# Altium schematic sheet can&usb.SchDoc
size 317 x 304 mm; SheetNumber: 4; SheetTotal: 5
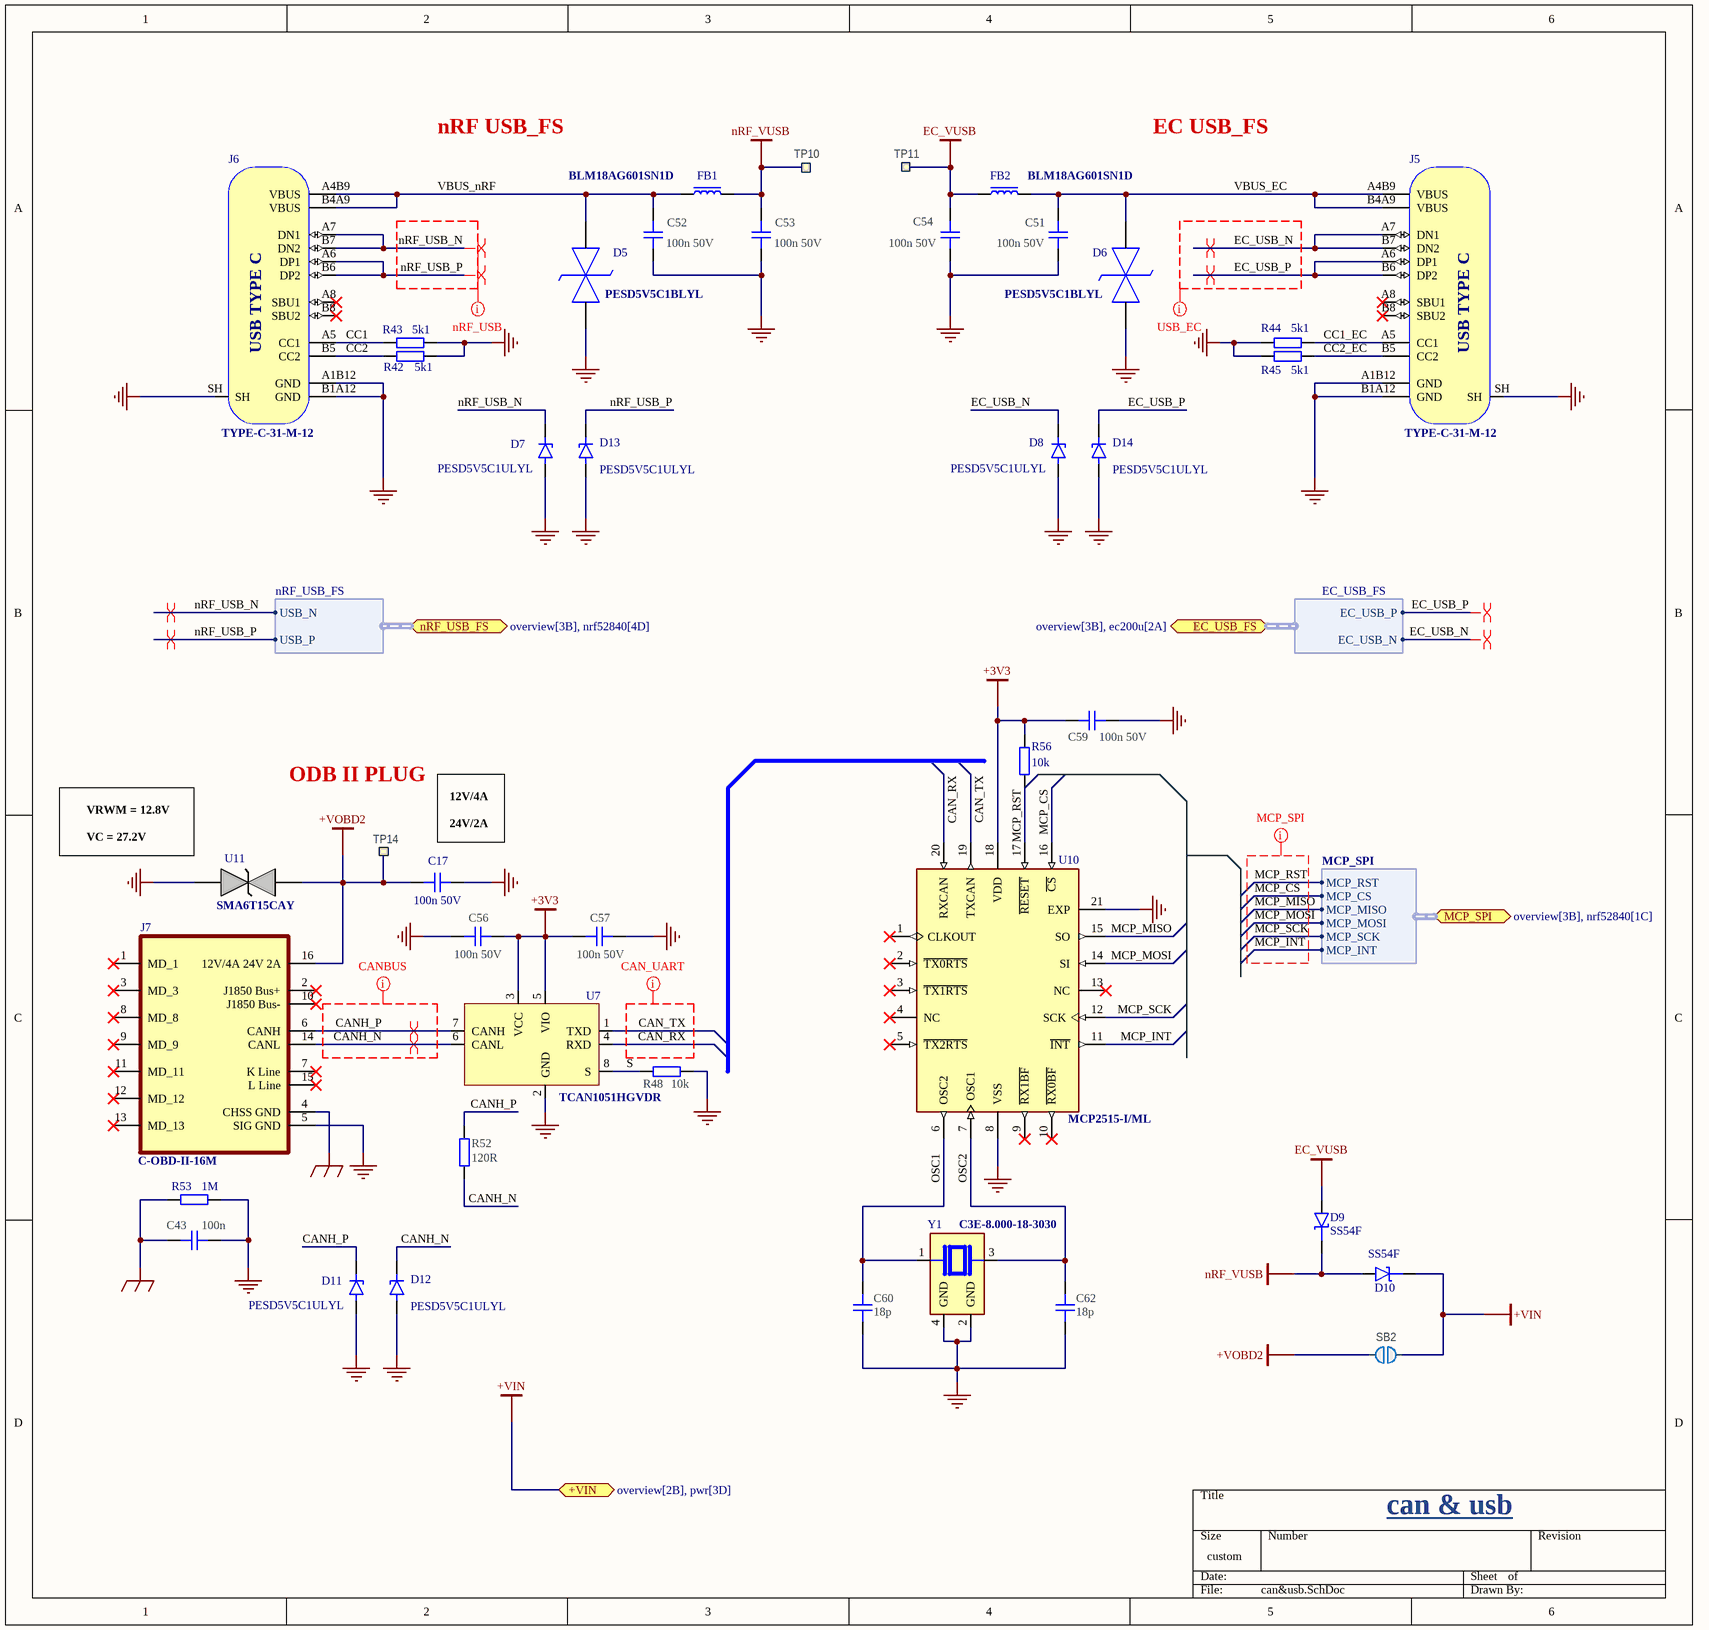
[diagram p0: can&usb.SchDoc]

## Parts
C17  100n 50V  [CAP_0805]
C43  100n  [CAPC2012X11L]
C51  100n 50V  [CAPC1005X04L]
C52  100n 50V  [CAPC1005X04L]
C53  100n 50V  [CAPC1005X04L]
C54  100n 50V  [CAPC1005X04L]
C56  100n 50V  [CAPC1005X04L]
C57  100n 50V  [CAPC1005X04L]
C59  100n 50V  [CAPC1005X04L]
C60  18p  [CAPC1005X04L]
C62  18p  [CAPC1005X04L]
D5  PESD5V5C1BLYL  [PESD5V5C1BLYL]
D6  PESD5V5C1BLYL  [PESD5V5C1BLYL]
D7  PESD5V5C1ULYL  [DIO_PESD5V5C1ULYL]
D8  PESD5V5C1ULYL  [DIO_PESD5V5C1ULYL]
D9  SS54F  [DIOM5226X100N]
D10  SS54F  [DIOM5226X100N]
D11  PESD5V5C1ULYL  [DIO_PESD5V5C1ULYL]
D12  PESD5V5C1ULYL  [DIO_PESD5V5C1ULYL]
D13  PESD5V5C1ULYL  [DIO_PESD5V5C1ULYL]
D14  PESD5V5C1ULYL  [DIO_PESD5V5C1ULYL]
FB1  BLM18AG601SN1D  [FB_0603]
FB2  BLM18AG601SN1D  [FB_0603]
J5  TYPE-C-31-M-12  [TYPE-C-31-M-12]
J6  TYPE-C-31-M-12  [TYPE-C-31-M-12]
J7  C-OBD-II-16M  [COMTECH_C-OBD-II-16M]
R42  5k1  [RES_0603]
R43  5k1  [RES_0603]
R44  5k1  [RES_0603]
R45  5k1  [RES_0603]
R48  10k  [RESC1005X04L]
R52  120R  [RESC1005X04L]
R53  1M  [RES_0603]
R56  10k  [RES_0603]
SB2  Solderbridge  [Solderbridge]  (value not drawn)  (no BOM)
TP10  Ø1.0mm,SMD  [TP_SMD_D1.0mm]  (value not drawn)  (no BOM)
TP11  Ø1.0mm,SMD  [TP_SMD_D1.0mm]  (value not drawn)  (no BOM)
TP14  Ø1.5mm,SMD  [TP_SMD_D1.5mm]  (value not drawn)  (no BOM)
U7  TCAN1051HGVDR  [SOIC-8]
U10  MCP2515-I/ML  [QFN50P400X400X100-21N]
U11  SMA6T15CAY  [SMA_BI_STM]
Y1  C3E-8.000-18-3030  [XTAL_C3E-8.000-18-3030-X-R]

## Ports
+VIN (bidir, see overview[2B], pwr[3D]), EC_USB_FS (bidir, harness EC_USB_FS, see overview[3B], ec200u[2A]), MCP_SPI (bidir, harness MCP_SPI, see overview[3B], nrf52840[1C]), nRF_USB_FS (bidir, harness nRF_USB_FS, see overview[3B], nrf52840[4D])

## Harnesses
nRF_USB_FS: USB_N, USB_P
EC_USB_FS: EC_USB_N, EC_USB_P
MCP_SPI: MCP_RST, MCP_CS, MCP_MISO, MCP_MOSI, MCP_SCK, MCP_INT

## Nets
+3V3: C56.1 C57.2 C59.2 R56.1 U7.3(VCC) U7.5(VIO) U10.18(VDD)
+VIN: D10.K SB2.1 ; port +VIN
+VOBD2: C17.2 J7.16(12V/4A_24V_2A) SB2.2 TP14.1 U11.2
C_GND: C43.1 J7.4(CHSS_GND) R53.1
EC_VUSB: C54.1 D9.A FB2.1 TP11.1
GND: C17.1 C43.2 C51.2 C52.2 C53.2 C54.2 C56.2 C57.1 C59.1 C60.1 C62.1 D5.2(K2) D6.2(K2) D7.A D8.A D11.A D12.A D13.A D14.A J5.A1B12(GND) J5.B1A12(GND) J5.SH J6.A1B12(GND) J6.B1A12(GND) J6.SH J7.5(SIG_GND) R42.1 R43.1 R44.1 R45.1 R48.2 R53.2 U7.2(GND) U10.8(VSS) U10.21(EXP) U11.1 Y1.2(GND) Y1.4(GND)
nRF_VUSB: C53.1 D9.K D10.A FB1.1 TP10.1
CAN_RX: U7.4(RXD) U10.20(RXCAN)
CAN_TX: U7.1(TXD) U10.19(TXCAN)
CANH_N: D12.K J7.14(CANL) R52.2 U7.6(CANL)
CANH_P: D11.K J7.6(CANH) R52.1 U7.7(CANH)
CC1: J6.A5(CC1) R43.2
CC1_EC: J5.A5(CC1) R44.2
CC2: J6.B5(CC2) R42.2
CC2_EC: J5.B5(CC2) R45.2
EC_USB_N: D8.K J5.A7(DN1) J5.B7(DN2) ; port EC_USB_FS.EC_USB_N
EC_USB_P: D14.K J5.A6(DP1) J5.B6(DP2) ; port EC_USB_FS.EC_USB_P
MCP_CS: U10.16(~{CS}) ; port MCP_SPI.MCP_CS
MCP_INT: U10.11(~{INT}) ; port MCP_SPI.MCP_INT
MCP_MISO: U10.15(SO) ; port MCP_SPI.MCP_MISO
MCP_MOSI: U10.14(SI) ; port MCP_SPI.MCP_MOSI
MCP_RST: R56.2 U10.17(~{RESET}) ; port MCP_SPI.MCP_RST
MCP_SCK: U10.12(SCK) ; port MCP_SPI.MCP_SCK
nRF_USB_N: D7.K J6.A7(DN1) J6.B7(DN2) ; port nRF_USB_FS.USB_N
nRF_USB_P: D13.K J6.A6(DP1) J6.B6(DP2) ; port nRF_USB_FS.USB_P
OSC1: C60.2 U10.6(OSC2) Y1.1
OSC2: C62.2 U10.7(OSC1) Y1.3
S: R48.1 U7.8(S)
VBUS_EC: C51.1 D6.1(K1) FB2.2 J5.A4B9(VBUS) J5.B4A9(VBUS)
VBUS_nRF: C52.1 D5.1(K1) FB1.2 J6.A4B9(VBUS) J6.B4A9(VBUS)

Not connected (* = marked no-connect by the designer): J5 A8(SBU1)* B8(SBU2)*; J6 A8(SBU1)* B8(SBU2)*; J7 1(MD_1)* 2(J1850_Bus+)* 3(MD_3)* 7(K_Line)* 8(MD_8)* 9(MD_9)* 10(J1850_Bus-)* 11(MD_11)* 12(MD_12)* 13(MD_13)* 15(L_Line)*; U10 1(CLKOUT)* 2(~{TX0RTS})* 3(~{TX1RTS})* 4(NC)* 5(~{TX2RTS})* 9(~{RX1BF})* 10(~{RX0BF})* 13(NC)*

## Layout directives
differential pair: CANH_N, CANH_P, EC_USB_N, EC_USB_P, nRF_USB_N, nRF_USB_P
net class CANBUS: CANH_N, CANH_P
net class CAN_UART: CAN_RX, CAN_TX
net class nRF_USB: nRF_USB_N, nRF_USB_P
net class USB_EC: EC_USB_N, EC_USB_P
mark named MCP_SPI: MCP_CS, MCP_INT, MCP_MISO, MCP_MOSI, MCP_RST, MCP_SCK

## Notes on the sheet
- nRF USB_FS
- EC USB_FS
- ODB II PLUG
- 12V/4A
  24V/2A
- (near U11) VRWM = 12.8V
  VC = 27.2V
- can & usb
- (in symbol TYPE-C-31-M-12) USB TYPE C

## Library data of the parts
C17 = CAP_0805: Capacitor SMD 0805; Manufacturer: *; Manufacturer Part Number: *; Distributor Link: *; LCSC: *; Rating: *; Dielectric: *
C43 = C0805-4µ7: Capacitor, X5R, ±10%, 16V; Manufacturer: N.A.; Part number IPS: 00000006289; Part number NEMS: 100200284; Value: 4.7µF; Artikkelnr Noca: 20039266; Pad Count: 2; Component Status: Active; Part Number: C0805-4µ7; Manufacturer Part Number: N.A.; ComponentLink1URL: N.A.; ComponentLink1Description: Datasheet; ComponentLink2URL: N.A.; ComponentLink2Description: Supplier link; HelpURL: N.A.; Footprint Doc: 0805; LatestRevisionDate: 2020-04-28; Published: 2009-08-21; Note: 16V; Supplier 1: N.A.; Supplier Part Number 1: N.A.; Supplier 2: N.A.; Supplier Part Number 2: N.A.; PartId: 100200284; Component Class: Capacitors; Author: rsk; Part number Norautron: N.A.
C51-C54 C56 C57 C59 C60 C62 = C0402-4µ7: Capacitor, X5R, ±20%; Manufacturer: N.A.; Part number IPS: 00000001251, 00000007165; Part number NEMS: 100200193; Value: 4.7µF; Note: 10V; Artikkelnr Noca: 20039482; Pad Count: 2; Component Status: Active; Part Number: C0402-4µ7; Manufacturer Part Number: N.A.; ComponentLink1URL: N.A.; ComponentLink1Description: Datasheet; ComponentLink2URL: N.A.; ComponentLink2Description: Supplier link; HelpURL: N.A.; Footprint Doc: 0402; LatestRevisionDate: 2017-11-09; Published: 2009-05-08; Supplier 1: Digi-Key; Supplier Part Number 1: 490-13252-1-ND; Supplier 2: N.A.; Supplier Part Number 2: N.A.; PartId: 100200193; Component Class: Capacitors; Author: rsk; Part number Norautron: N.A.
D5 D6 = PESD5V5C1BLYL: PESD5V5C1BL - Extremely low clamping bidirectional ESD protection diode@en-us; Manufacturer_Name: Nexperia; Geometry.Height: 0.5mm; Manufacturer_Part_Number: PESD5V5C1BLYL; Mouser Part Number: 771-PESD5V5C1BLYL; Mouser Price/Stock: https://www.mouser.co.uk/ProductDetail/Nexperia/PESD5V5C1BLYL?qs=3Rah4i%252BhyCFwc8nZBq0KPQ%3D%3D; Arrow Part Number: PESD5V5C1BLYL; Arrow Price/Stock: https://www.arrow.com/en/products/pesd5v5c1blyl/nexperia?utm_currency=USD&region=nac; Datasheet Link: https://assets.nexperia.com/documents/data-sheet/PESD5V0S1BA_BB_BL.pdf
D7 D8 D11-D14 = PESD5V5C1ULYL: Esd Protection Device, 5.5V, Dfn1006 Rohs Compliant: Yes |Nexperia PESD5V5C1ULYL; MF: Nexperia USA Inc.; SnapEDA_Link: https://www.snapeda.com/parts/PESD5V5C1ULYL/Nexperia/view-part/?ref=snap; Package: SOD-882 Nexperia USA; Value: *; MP: PESD5V5C1ULYL; Check_prices: https://www.snapeda.com/parts/PESD5V5C1ULYL/Nexperia/view-part/?ref=eda
D9 D10 = Schottky Diode_3: Schottky Diode SMD SMAF package
FB1 FB2 = FB_0603: Ferrite Bead SMD 0603; Manufacturer: *; Manufacturer Part Number: *; Distributor Link: *; LCSC: *
J5 J6 = TYPE-C-31-M-12: USB Type C Connector Horizontal SMT; Manufacturer: Koren Hroparts; Manufacturer Part Number: TYPE-C-31-M-12
J7 = C-OBD-II-16M: OBD II 16pin 90 Degree Angle Male Plug Connector; MF: Comtech Electronic Co., LTD; SnapEDA_Link: https://www.snapeda.com/parts/C-OBD-II-16M/Comtech+Electronic+Co.%252C+LTD/view-part/?ref=snap; Package: None; Value: *; MP: C-OBD-II-16M; Check_prices: https://www.snapeda.com/parts/C-OBD-II-16M/Comtech+Electronic+Co.%252C+LTD/view-part/?ref=eda
R42-R45 R53 R56 = RES_0603: Resistor SMD 0603; Manufacturer: *; Manufacturer Part Number: *; Distributor Link: *; LCSC: *
R48 R52 = R0402-0R: Resistor, ±5%, 0.063W; Manufacturer: N.A.; Part number IPS: 00000007128; Part number NEMS: 100100109; Value: 0R; Note: Chip Res 5%; Artikkelnr Noca: 27049000; Pad Count: 2; Component Status: Active; Part Number: R0402-0R; Manufacturer Part Number: N.A.; ComponentLink1URL: N.A.; ComponentLink1Description: Datasheet; ComponentLink2URL: N.A.; ComponentLink2Description: Supplier link; HelpURL: N.A.; Footprint Doc: 0402; LatestRevisionDate: 2009-11-23; Published: 2009-05-08; Supplier 1: Farnell; Supplier Part Number 1: 146-9661; Supplier 2: N.A.; Supplier Part Number 2: N.A.; PartId: 100100109; Component Class: Resistors; Author: rsk; Part number Norautron: N.A.
SB2 = Solderbridge: Manufacturer: N.A.; Part number NEMS: 100500458; Pad Count: 2; Component Status: Active; System: Connector; Part Number: Solderbridge; Manufacturer Part Number: N.A.; LatestRevisionDate: 2009-12-14; Published: 2009-12-14; Value: Solderbridge; Note: N.A.; Artikkelnr Noca: N.A.; Footprint Doc: Solderbridge; Part number IPS: N.A.; ComponentLink1URL: N.A.; ComponentLink1Description: Datasheet; ComponentLink2URL: N.A.; ComponentLink2Description: Supplier link; HelpURL: N.A.; Supplier 1: N.A.; Supplier Part Number 1: N.A.; Supplier 2: N.A.; Supplier Part Number 2: N.A.; PartId: 100500458; Component Class: Connectors; Author: rsk; Part number Norautron: N.A.
TP10 TP11 = TP_SMD_Ø1.0MM: 1.0mm circular SMD testpad; Manufacturer: Nordic Semiconductor; Manufacturer Part Number: N.A.; Part number NEMS: 100500475; Pad Count: 1; Component Status: Active; Part Number: TP_SMD_Ø1.0MM; ComponentLink1URL: N.A.; ComponentLink1Description: Datasheet; ComponentLink2URL: N.A.; ComponentLink2Description: Supplier link; HelpURL: N.A.; Footprint Doc: TP_SMD_Ø1.0mm; LatestRevisionDate: 2021-03-05; Published: 2013-06-11; Value: Ø1.0mm,SMD; Note: N.A.; Artikkelnr Noca: N.A.; Part number IPS: N.A.; Supplier 1: N.A.; Supplier Part Number 1: N.A.; Supplier 2: N.A.; Supplier Part Number 2: N.A.; PartId: 100500475; Component Class: Connectors; Author: rsk; Part number Norautron: N.A.
TP14 = TP_SMD_Ø1.5MM: 1.5mm circular SMD testpad; Manufacturer: Nordic Semiconductor; Manufacturer Part Number: N.A.; Part number NEMS: 100500477; Pad Count: 1; Component Status: Active; Part Number: TP_SMD_Ø1.5MM; ComponentLink1URL: N.A.; ComponentLink1Description: Datasheet; ComponentLink2URL: N.A.; ComponentLink2Description: Supplier link; HelpURL: N.A.; Footprint Doc: TP_SMD_Ø1.5mm; LatestRevisionDate: 2021-03-05; Published: 2016-06-02; Value: Ø1.5mm,SMD; Note: N.A.; Artikkelnr Noca: N.A.; Part number IPS: N.A.; Supplier 1: N.A.; Supplier Part Number 1: N.A.; Supplier 2: N.A.; Supplier Part Number 2: N.A.; PartId: 100500477; Component Class: Connectors; Author: rsk; Part number Norautron: N.A.
U7 = TCAN1051HGVDR: 5Mbps CAN Transceiver SOIC-8 CAN Transceivers ROHS
U10 = MCP2515-I/ML: Microchip MCP2515-I/ML, CAN Controller 1Mbit/s CAN 2.0B, 20-Pin QFN | Microchip Technology Inc. MCP2515-I/ML; SnapEDA_Link: https://www.snapeda.com/parts/MCP2515-I/ML/Microchip+Technology/view-part/?ref=snap; Package: VFQFN-20 Microchip; Value: *; MF: Microchip Technology; MP: MCP2515-I/ML; Check_prices: https://www.snapeda.com/parts/MCP2515-I/ML/Microchip+Technology/view-part/?ref=eda
U11 = SMA6T15CAY: Automotive 600 W, 12.8 V TVS in SMA; Manufacturer_Name: STMicroelectronics; Copyright: Copyright (C) 2026 Ultra Librarian. All rights reserved.; Manufacturer_Part_Number: SMA6T15CAY; Datasheet: https://www.st.com/resource/en/datasheet/sma6ty.pdf; Digi-Key_Part_Number_1: 497-11826-2-ND; Digi-Key_Part_Number_2: 497-11826-1-ND; Digi-Key_Part_Number_3: 497-11826-6-ND; RefDes: RefDes; Type: Type
Y1 = C3E-8.000-18-3030-X-R: Crystal, 3.20mm x2.50mm,8MHz,18pF,-40-85C; MF: Aker Technology USA; SnapEDA_Link: https://www.snapeda.com/parts/C3E-8.000-18-3030-X-R/Aker/view-part/?ref=snap; Package: SMD-4 Aker; Value: *; MP: C3E-8.000-18-3030-X-R; Check_prices: https://www.snapeda.com/parts/C3E-8.000-18-3030-X-R/Aker/view-part/?ref=eda